# EAGLE design pcb_kamex_fuentes_5v_7amp_1.0 (EAGLE 7.6.0)
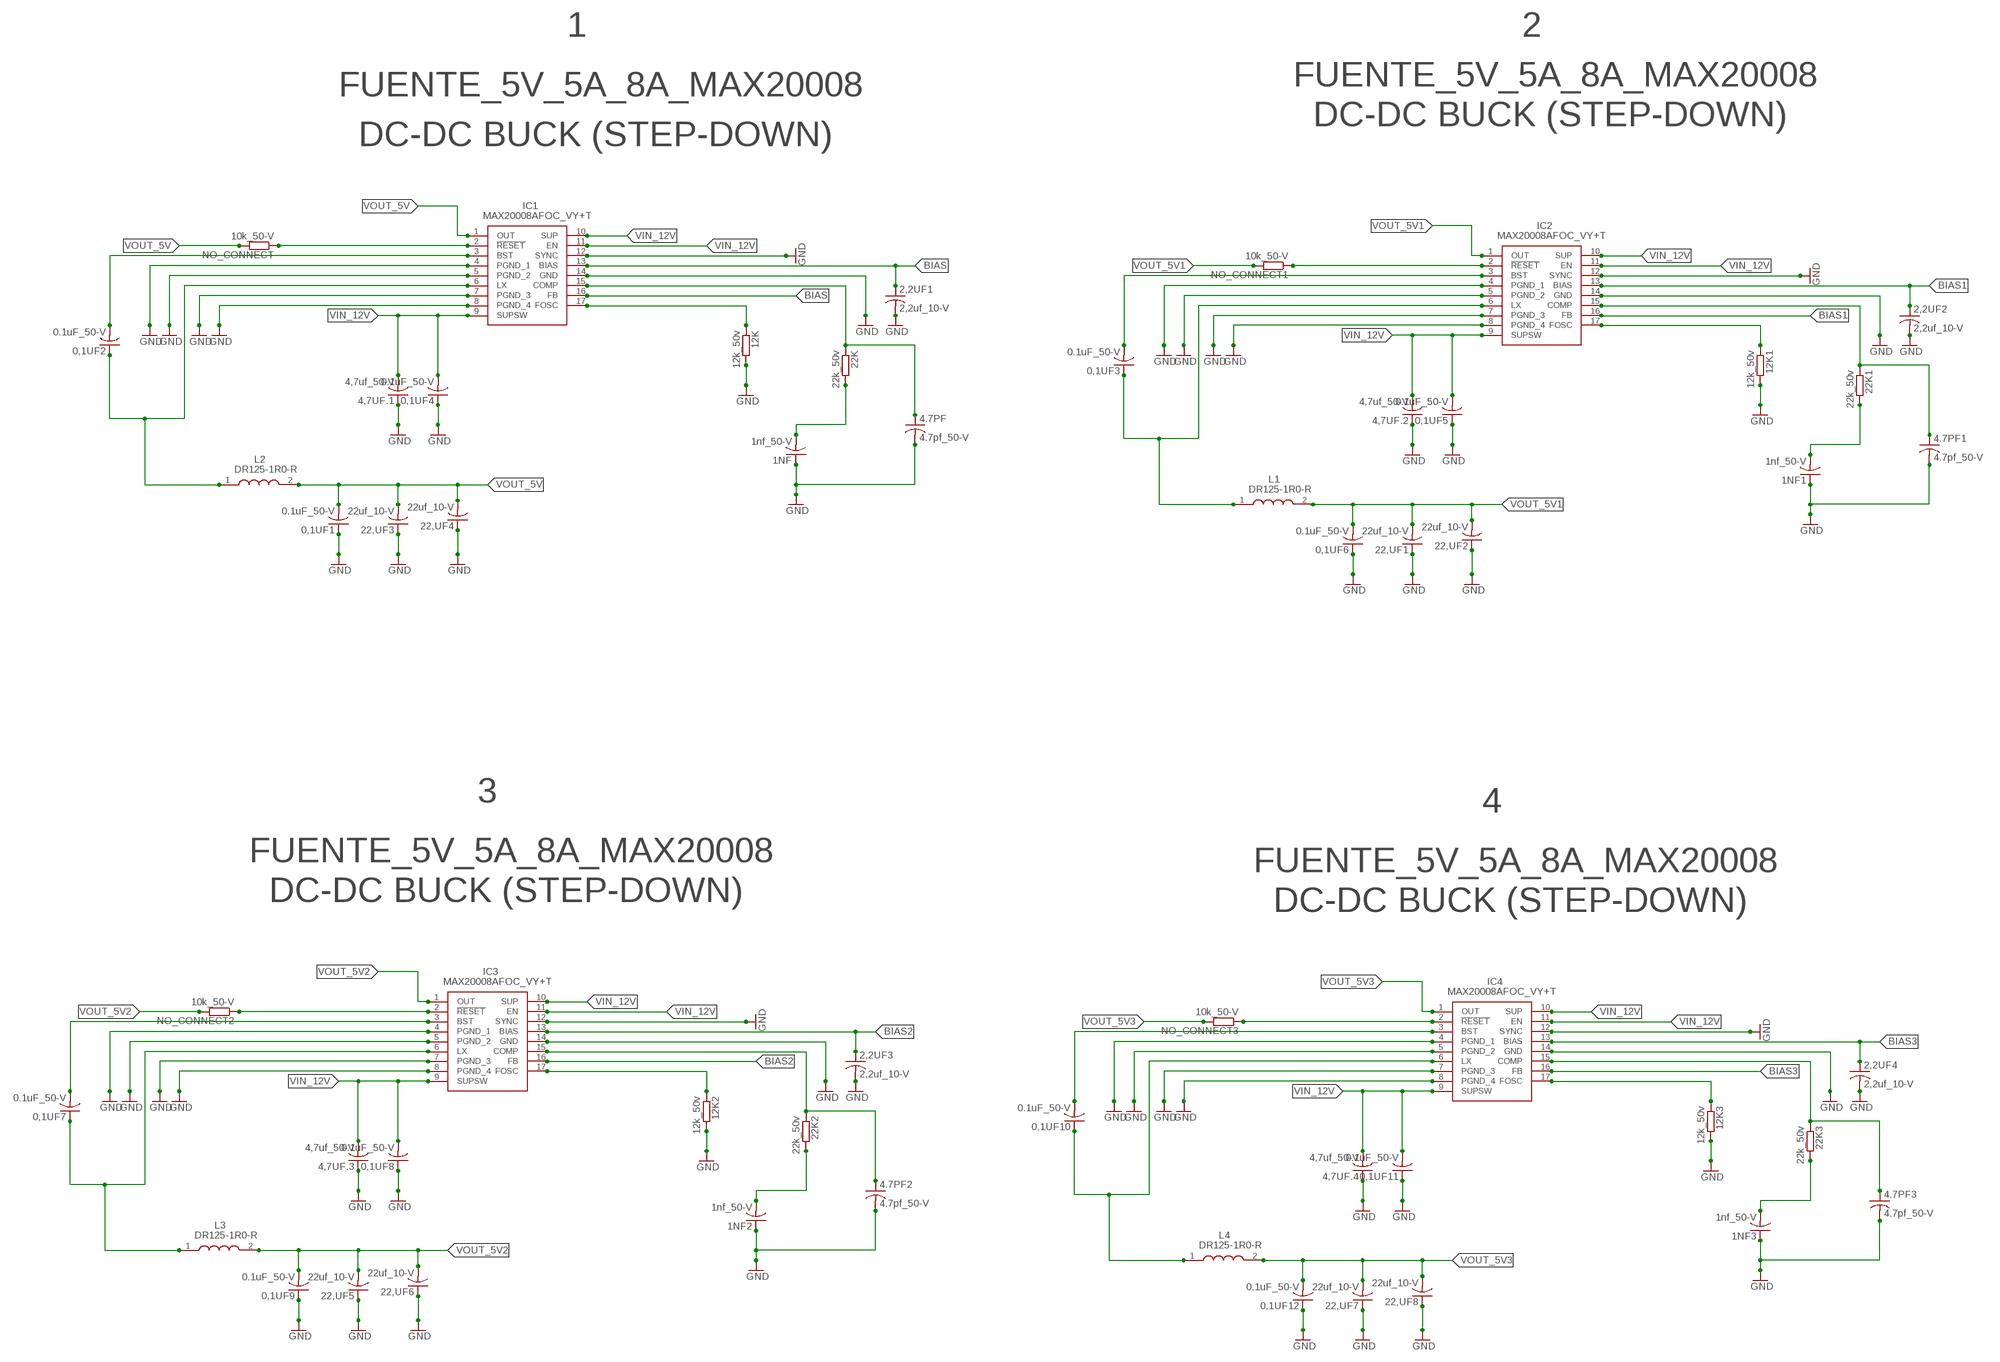
[diagram p0: schematic, sheet 1]

## Parts
0,1UF1  0.1uF_50-V  C-USC0805  [C0805]
0,1UF2  0.1uF_50-V  C-USC0805  [C0805]
0,1UF3  0.1uF_50-V  C-USC0805  [C0805]
0,1UF4  0.1uF_50-V  C-USC0805  [C0805]
0,1UF5  0.1uF_50-V  C-USC0805  [C0805]
0,1UF6  0.1uF_50-V  C-USC0805  [C0805]
0,1UF7  0.1uF_50-V  C-USC0805  [C0805]
0,1UF8  0.1uF_50-V  C-USC0805  [C0805]
0,1UF9  0.1uF_50-V  C-USC0805  [C0805]
0,1UF10  0.1uF_50-V  C-USC0805  [C0805]
0,1UF11  0.1uF_50-V  C-USC0805  [C0805]
0,1UF12  0.1uF_50-V  C-USC0805  [C0805]
1NF  1nf_50-V  C-USC0805  [C0805]
1NF1  1nf_50-V  C-USC0805  [C0805]
1NF2  1nf_50-V  C-USC0805  [C0805]
1NF3  1nf_50-V  C-USC0805  [C0805]
2,2UF1  2,2uf_10-V  C-USC0805  [C0805]
2,2UF2  2,2uf_10-V  C-USC0805  [C0805]
2,2UF3  2,2uf_10-V  C-USC0805  [C0805]
2,2UF4  2,2uf_10-V  C-USC0805  [C0805]
4,7UF.1  4,7uf_50-V  C-USC0805  [C0805]
4,7UF.2  4,7uf_50-V  C-USC0805  [C0805]
4,7UF.3  4,7uf_50-V  C-USC0805  [C0805]
4,7UF.4  4,7uf_50-V  C-USC0805  [C0805]
4.7PF  4.7pf_50-V  C-USC0805  [C0805]
4.7PF1  4.7pf_50-V  C-USC0805  [C0805]
4.7PF2  4.7pf_50-V  C-USC0805  [C0805]
4.7PF3  4.7pf_50-V  C-USC0805  [C0805]
12K  12k_50v  R-EU_M0805  [M0805]
12K1  12k_50v  R-EU_M0805  [M0805]
12K2  12k_50v  R-EU_M0805  [M0805]
12K3  12k_50v  R-EU_M0805  [M0805]
22,UF1  22uf_10-V  C-USC0805  [C0805]
22,UF2  22uf_10-V  C-USC0805  [C0805]
22,UF3  22uf_10-V  C-USC0805  [C0805]
22,UF4  22uf_10-V  C-USC0805  [C0805]
22,UF5  22uf_10-V  C-USC0805  [C0805]
22,UF6  22uf_10-V  C-USC0805  [C0805]
22,UF7  22uf_10-V  C-USC0805  [C0805]
22,UF8  22uf_10-V  C-USC0805  [C0805]
22K  22k_50v  R-EU_M0805  [M0805]
22K1  22k_50v  R-EU_M0805  [M0805]
22K2  22k_50v  R-EU_M0805  [M0805]
22K3  22k_50v  R-EU_M0805  [M0805]
IC1  MAX20008AFOC_VY+T  [MAX20008AFOCVYT]
IC2  MAX20008AFOC_VY+T  [MAX20008AFOCVYT]
IC3  MAX20008AFOC_VY+T  [MAX20008AFOCVYT]
IC4  MAX20008AFOC_VY+T  [MAX20008AFOCVYT]
L1  DR125-1R0-R  [INDPM125125X600N]
L2  DR125-1R0-R  [INDPM125125X600N]
L3  DR125-1R0-R  [INDPM125125X600N]
L4  DR125-1R0-R  [INDPM125125X600N]
NO_CONNECT  10k_50-V  R-EU_M0805  [M0805]
NO_CONNECT1  10k_50-V  R-EU_M0805  [M0805]
NO_CONNECT2  10k_50-V  R-EU_M0805  [M0805]
NO_CONNECT3  10k_50-V  R-EU_M0805  [M0805]

## Nets
BIAS: 2,2UF1.1 IC1.13(BIAS) IC1.16(FB)
BIAS1: 2,2UF2.1 IC2.13(BIAS) IC2.16(FB)
BIAS2: 2,2UF3.1 IC3.13(BIAS) IC3.16(FB)
BIAS3: 2,2UF4.1 IC4.13(BIAS) IC4.16(FB)
BST: 0,1UF2.2 IC1.3(BST)
BST1: 0,1UF3.2 IC2.3(BST)
BST2: 0,1UF7.2 IC3.3(BST)
BST3: 0,1UF10.2 IC4.3(BST)
COM: 4.7PF.1 22K.1 IC1.15(COMP)
COM1: 4.7PF1.1 22K1.1 IC2.15(COMP)
COM2: 4.7PF2.1 22K2.1 IC3.15(COMP)
COM3: 4.7PF3.1 22K3.1 IC4.15(COMP)
GND [power]: 0,1UF1.1 0,1UF4.1 0,1UF5.1 0,1UF6.1 0,1UF8.1 0,1UF9.1 0,1UF11.1 0,1UF12.1 1NF1.1 1NF2.1 1NF3.1 1NF.1 2,2UF1.2 2,2UF2.2 2,2UF3.2 2,2UF4.2 4,7UF.1.1 4,7UF.2.1 4,7UF.3.1 4,7UF.4.1 4.7PF1.2 4.7PF2.2 4.7PF3.2 4.7PF.2 12K1.2 12K2.2 12K3.2 12K.2 22,UF1.1 22,UF2.1 22,UF3.1 22,UF4.1 22,UF5.1 22,UF6.1 22,UF7.1 22,UF8.1 IC1.4(PGND_1) IC1.5(PGND_2) IC1.7(PGND_3) IC1.8(PGND_4) IC1.12(SYNC) IC1.14(GND) IC2.4(PGND_1) IC2.5(PGND_2) IC2.7(PGND_3) IC2.8(PGND_4) IC2.12(SYNC) IC2.14(GND) IC3.4(PGND_1) IC3.5(PGND_2) IC3.7(PGND_3) IC3.8(PGND_4) IC3.12(SYNC) IC3.14(GND) IC4.4(PGND_1) IC4.5(PGND_2) IC4.7(PGND_3) IC4.8(PGND_4) IC4.12(SYNC) IC4.14(GND)
N$1: 12K1.1 IC2.17(FOSC)
N$2: 1NF.2 22K.2
N$4: 0,1UF3.1 IC2.6(LX) L1.1
N$5: IC2.2(!RESET) NO_CONNECT1.1
N$6: 1NF1.2 22K1.2
N$7: 12K.1 IC1.17(FOSC)
N$9: 12K2.1 IC3.17(FOSC)
N$10: 0,1UF7.1 IC3.6(LX) L3.1
N$11: 0,1UF2.1 IC1.6(LX) L2.1
N$12: IC1.2(!RESET) NO_CONNECT.1
N$13: IC3.2(!RESET) NO_CONNECT2.1
N$14: 1NF2.2 22K2.2
N$16: 12K3.1 IC4.17(FOSC)
N$17: 0,1UF10.1 IC4.6(LX) L4.1
N$18: IC4.2(!RESET) NO_CONNECT3.1
N$19: 1NF3.2 22K3.2
VIN_12V [power]: 0,1UF4.2 0,1UF5.2 0,1UF8.2 0,1UF11.2 4,7UF.1.2 4,7UF.2.2 4,7UF.3.2 4,7UF.4.2 IC1.9(SUPSW) IC1.10(SUP) IC1.11(EN) IC2.9(SUPSW) IC2.10(SUP) IC2.11(EN) IC3.9(SUPSW) IC3.10(SUP) IC3.11(EN) IC4.9(SUPSW) IC4.10(SUP) IC4.11(EN)
VOUT_5V: 0,1UF1.2 22,UF3.2 22,UF4.2 IC1.1(OUT) L2.2 NO_CONNECT.2
VOUT_5V1: 0,1UF6.2 22,UF1.2 22,UF2.2 IC2.1(OUT) L1.2 NO_CONNECT1.2
VOUT_5V2: 0,1UF9.2 22,UF5.2 22,UF6.2 IC3.1(OUT) L3.2 NO_CONNECT2.2
VOUT_5V3: 0,1UF12.2 22,UF7.2 22,UF8.2 IC4.1(OUT) L4.2 NO_CONNECT3.2

## Notes on the sheet
- 1 | 2
- FUENTE_5V_5A_8A_MAX20008 | FUENTE_5V_5A_8A_MAX20008
- DC-DC BUCK (STEP-DOWN)
- DC-DC BUCK (STEP-DOWN)
- 3 | 4
- FUENTE_5V_5A_8A_MAX20008 | FUENTE_5V_5A_8A_MAX20008
- DC-DC BUCK (STEP-DOWN) | DC-DC BUCK (STEP-DOWN)

## Library data of the parts
0,1UF1-0,1UF12 1NF 1NF1-1NF3 2,2UF1-2,2UF4 4,7UF.1-4,7UF.4 4.7PF 4.7PF1-4.7PF3 22,UF1-22,UF8 = rcl:C-US: CAPACITOR, American symbol
12K 12K1-12K3 22K 22K1-22K3 NO_CONNECT NO_CONNECT1-NO_CONNECT3 = rcl_dani:R-EU_: RESISTOR, European symbol
IC1-IC4 = MAX20008AFOC_VY+T:MAX20008AFOC_VY+T: Switching Voltage Regulators 36V, 220kHz to 2.2MHz, 4A/6A/8A Fully integrated step down converter Source: Datasheet <https://componentsearchengine.com//MAX20008AFOC_VY T.pdf>; DESCRIPTION: Switching Voltage Regulators 36V, 220kHz to 2.2MHz, 4A/6A/8A Fully integrated step down converter; HEIGHT: 0.75mm; MANUFACTURER_NAME: Analog Devices; MANUFACTURER_PART_NUMBER: MAX20008AFOC/VY+T; MOUSER_PART_NUMBER: 700-MAX20008AFOC/VYT; MOUSER_PRICE-STOCK: https://www.mouser.co.uk/ProductDetail/Analog-Devices-Maxim-Integrated/MAX20008AFOC-VY%2bT?qs=vLWxofP3U2wvQQR8GkDmgw%3D%3D
L1-L4 = DR125-1R0-R:DR125-1R0-R: Inductor Power Shielded Drum Core 0.894uH/1uH 20% 100KHz Ferrite 15A 0.0024Ohm DCR T/R Source: Datasheet <https://www.eaton.com/content/dam/eaton/products/electronic-components/resources/data-sheet/eaton-dr-high-power-density-high-efficiency-shielded-drum-core-power-inductors-data-sheet.pdf>; DESCRIPTION: Inductor Power Shielded Drum Core 0.894uH/1uH 20% 100KHz Ferrite 15A 0.0024Ohm DCR T/R; HEIGHT: 6mm; MANUFACTURER_NAME: Eaton; MANUFACTURER_PART_NUMBER: DR125-1R0-R

## Net classes
0 default: width 0.381 mm, drill 0.01 mm, clearance 0.254 mm
1 power: width 1.27 mm, drill 0.762 mm, clearance 0.254 mm
2 thin: width 0.254 mm, drill 0.254 mm, clearance 0.254 mm

## Board
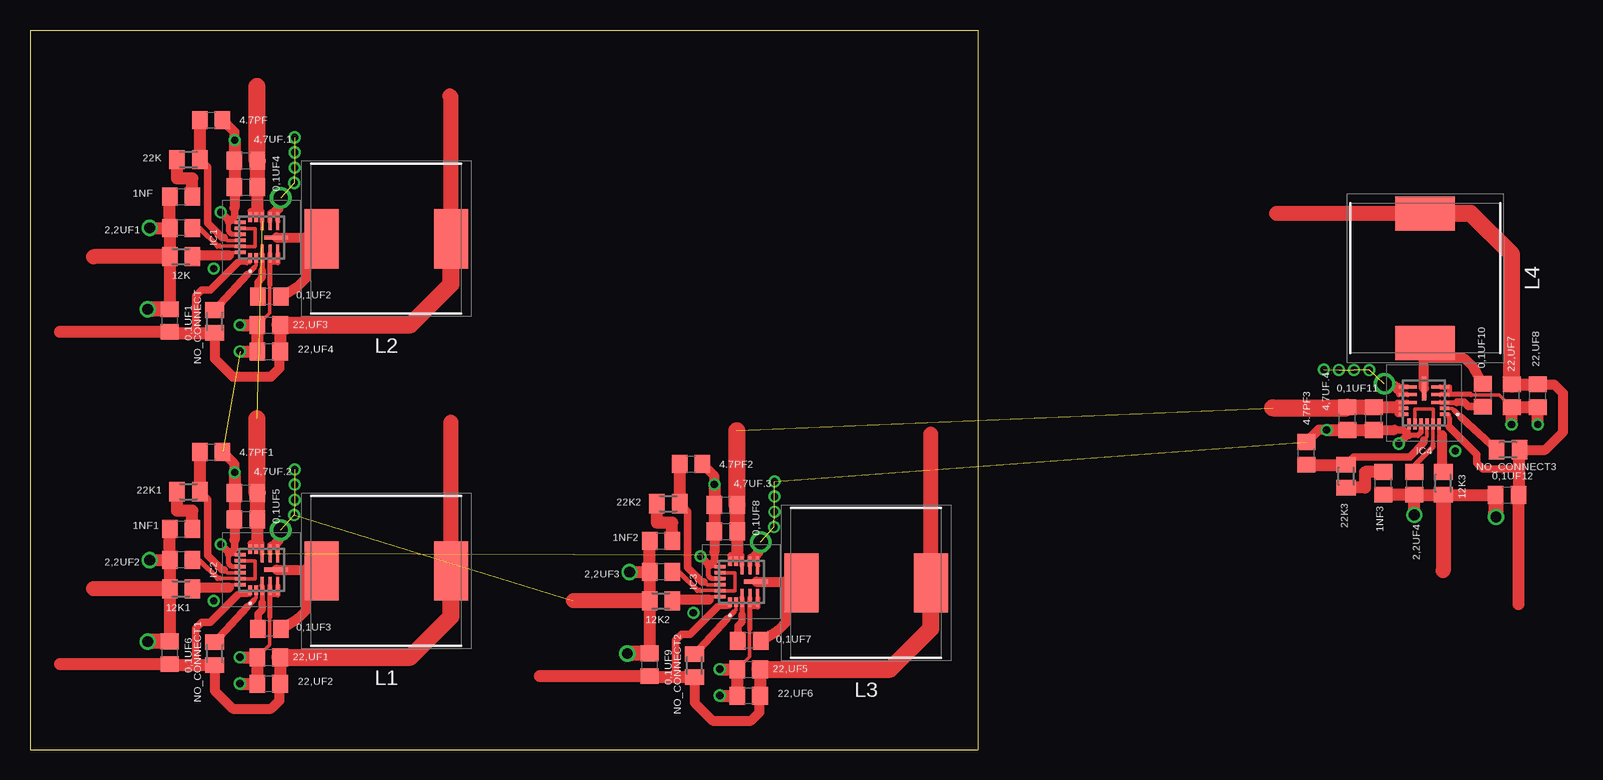
[diagram p1: board, top side]
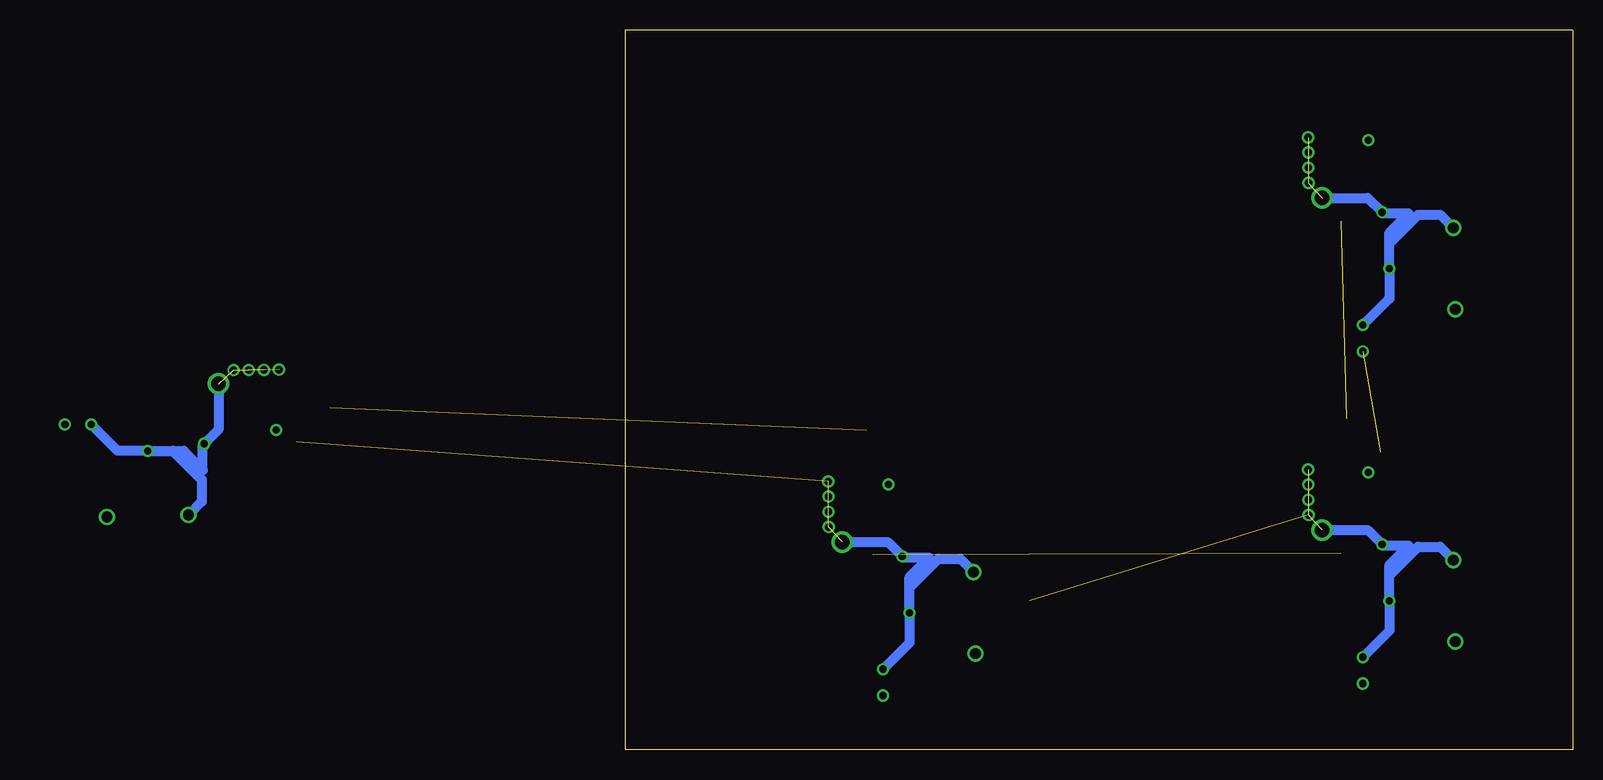
[diagram p2: board, bottom side, seen from below]

Size 79 x 60 mm. Coordinates in mm from the lower left corner, seen from the top.
Outline: 0,0 79,0 79,60 0,60 0,0
Copper layers (1*16): Top 0.035mm / dielectric 1.5mm / Bottom 0.035mm
Design rules "default *": minimum track width 10mil, minimum drill 24mil, track to track 8mil, track to pad 8mil, pad to pad 8mil, via to via 8mil, smd to smd 8mil, copper to edge 10mil, drill to drill 8mil, minimum pad ring 10mil, minimum via ring 8mil, stop-mask expansion 4mil, vias tented up to drill 0mil, thermal gap 10mil
Holes 3.2 mm at -98.9,24.6 -101,47.8

### Footprints (pad centres in the part's own frame; a part is rotated, then mirrored left to right if it is on the bottom)
C0805 = smd 1.3 x 1.5: 1 -0.95,0; 2 0.95,0
M0805 = smd 1.3 x 1.6: 1 -0.95,0; 2 0.95,0
MAX20008AFOCVYT = smd 0.8 x 0.3: 1 -1.7,0.948; 2 -1.7,0.45; 10 1.7,0.45; 11 1.7,0.948 | smd 1.5 x 0.25: 3 -1.35,-0.05; 4 -1.35,-0.7; 5 -1.35,-1.35; 7 1.35,-1.35; 8 1.35,-0.7; 9 1.35,-0.05 | smd 0.35 x 2: 6 0,-1.225 | smd 0.3 x 0.925: 12 1.25,1.763; 13 0.75,1.763; 14 0.25,1.763; 15 -0.25,1.763; 16 -0.75,1.763; 17 -1.25,1.763
INDPM125125X600N = smd 2.85 x 4.95: 1 -5.4,0; 2 5.4,0

### Placement (x,y rotation side)
0,1UF1  11.63,35.77 270 top
0,1UF2  19.95,37.78 180 top
0,1UF3  19.95,10.08 180 top
0,1UF4  18,46.9 0 top
0,1UF5  18,19.2 0 top
0,1UF6  11.63,8.07 270 top
0,1UF7  59.95,9.08 180 top
0,1UF8  58,18.2 0 top
0,1UF9  51.63,7.07 270 top
0,1UF10  121.12,29.55 270 top  (outside the outline)
0,1UF11  112,27.6 90 top  (outside the outline)
0,1UF12  123.13,21.23 0 top  (outside the outline)
1NF  12.6,46.1 0 top
1NF1  12.6,18.4 0 top
1NF2  52.6,17.4 0 top
1NF3  112.8,22.2 90 top  (outside the outline)
2,2UF1  12.6,43.5 180 top
2,2UF2  12.6,15.8 180 top
2,2UF3  52.6,14.8 180 top
2,2UF4  115.4,22.2 270 top  (outside the outline)
4,7UF.1  18,49.1 0 top
4,7UF.2  18,21.4 0 top
4,7UF.3  58,20.4 0 top
4,7UF.4  109.8,27.6 90 top  (outside the outline)
4.7PF  15.1,52.5 0 top
4.7PF1  15.1,24.8 0 top
4.7PF2  55.1,23.8 0 top
4.7PF3  106.4,24.7 90 top  (outside the outline)
12K  12.6,41.1 180 top
12K1  12.6,13.4 180 top
12K2  52.6,12.4 180 top
12K3  117.8,22.2 270 top  (outside the outline)
22,UF1  19.9,7.7 0 top
22,UF2  19.9,5.5 0 top
22,UF3  19.9,35.4 0 top
22,UF4  19.9,33.2 0 top
22,UF5  59.9,6.7 0 top
22,UF6  59.9,4.5 0 top
22,UF7  123.5,29.5 90 top  (outside the outline)
22,UF8  125.7,29.5 90 top  (outside the outline)
22K  13.2,49.2 180 top
22K1  13.2,21.5 180 top
22K2  53.2,20.5 180 top
22K3  109.7,22.8 270 top  (outside the outline)
IC1  19.3,42.7 90 top
IC2  19.3,15 90 top
IC3  59.3,14 90 top
IC4  116.2,28.9 180 top  (outside the outline)
L1  29.7,14.9 0 top
L2  29.7,42.6 0 top
L3  69.7,13.9 0 top
L4  116.3,39.3 90 top  (outside the outline)
NO_CONNECT  15.4,35.7 270 top
NO_CONNECT1  15.4,8 270 top
NO_CONNECT2  55.4,7 270 top
NO_CONNECT3  123.2,25 0 top  (outside the outline)

### Tracks (layer width: path | path; a pad name or v marks a point on that pad's centre or on a via)
BIAS
  Top 0.305: IC1.13 18.79,43.45 18.79,41.94 IC1.16 17.53,41.96 15.89,41.96 | 2,2UF1.1 13.6,43.5
  Top 0.406: 15.89,41.96 15.64,41.96 14.2,43.4 13.65,43.4 2,2UF1.1
BIAS1
  Top 0.305: IC2.13 18.79,15.75 18.79,14.24 IC2.16 17.53,14.26 15.89,14.26 | 2,2UF2.1 13.6,15.8
  Top 0.406: 15.89,14.26 15.64,14.26 14.2,15.7 13.65,15.7 2,2UF2.1
BIAS2
  Top 0.305: IC3.13 58.79,14.75 58.79,13.24 IC3.16 57.53,13.26 55.89,13.26 | 2,2UF3.1 53.6,14.8
  Top 0.406: 55.89,13.26 55.64,13.26 54.2,14.7 53.65,14.7 2,2UF3.1
BIAS3
  Top 0.305: IC4.13 115.45,28.39 116.96,28.39 IC4.16 116.94,27.13 116.94,25.49 | 2,2UF4.1 115.4,23.2
  Top 0.406: 116.94,25.49 116.94,25.24 115.5,23.8 115.5,23.25 2,2UF4.1
BST
  Top 0.406: IC1.3 19.35,39.95
  Top 0.61: 0,1UF2.2 19,39 19.3,39.3 19.3,39.32 19.36,39.38 19.36,39.94 19.35,39.95
BST1
  Top 0.406: IC2.3 19.35,12.25
  Top 0.61: 0,1UF3.2 19,11.3 19.3,11.6 19.3,11.62 19.36,11.68 19.36,12.24 19.35,12.25
BST2
  Top 0.406: IC3.3 59.35,11.25
  Top 0.61: 0,1UF7.2 59,10.3 59.3,10.6 59.3,10.62 59.36,10.68 59.36,11.24 59.35,11.25
BST3
  Top 0.406: IC4.3 118.95,28.95
  Top 0.61: 0,1UF10.2 119.9,28.6 119.6,28.9 119.58,28.9 119.52,28.96 118.96,28.96 118.95,28.95
COM
  Top 0.305: IC1.15 16.45,42.45 16.2,42.7
  Top 0.61: 16.2,42.7 16,42.7 14.8,43.9 14.8,48.55 22K.1
  Top 1.016: 4.7PF.1 22K.1
COM1
  Top 0.305: IC2.15 16.45,14.75 16.2,15
  Top 0.61: 16.2,15 16,15 14.8,16.2 14.8,20.85 22K1.1
  Top 1.016: 4.7PF1.1 22K1.1
COM2
  Top 0.305: IC3.15 56.45,13.75 56.2,14
  Top 0.61: 56.2,14 56,14 54.8,15.2 54.8,19.85 22K2.1
  Top 1.016: 4.7PF2.1 22K2.1
COM3
  Top 0.305: IC4.15 116.45,26.05 116.2,25.8
  Top 0.61: 116.2,25.8 116.2,25.6 115,24.4 110.35,24.4 22K3.1
  Top 1.016: 4.7PF3.1 22K3.1
GND  (via drill 0.6, 0.9, 1.2)  (19 unrouted)
  Top 0.305: 20,38.76 19.96,38.72 19.96,36.41 22,UF3.1 | IC1.12 17.53,43.96 16.58,43.96 16.57,43.97 | 20,11.06 19.96,11.02 19.96,8.71 22,UF1.1 | IC2.12 17.53,16.26 16.58,16.26 16.57,16.27 | 60,10.06 59.96,10.02 59.96,7.71 22,UF5.1 | IC3.12 57.53,15.26 56.58,15.26 56.57,15.27 | 120.14,29.6 120.18,29.56 122.49,29.56 22,UF7.1 | IC4.12 114.94,27.13 114.94,26.18 114.93,26.17
  Top 0.406: IC1.7 20.65,44.8 | 20.65,44.8 20.4,44.8 20,44.8 IC1.8 | IC1.5 20.65,40.58 20.66,40.58 20.66,40.59 20,40.59 | 20,40.59 IC1.4 | 20.65,44.8 20.7,44.8 | IC1.14 16.83,42.95 16.58,43.2 16.58,43.96 | 20,38.76 20,40.59 | IC2.7 20.65,17.1 | 20.65,17.1 20.4,17.1 20,17.1 IC2.8 | IC2.5 20.65,12.88 20.66,12.88 20.66,12.89 20,12.89 | 20,12.89 IC2.4 | 20.65,17.1 20.7,17.1 | IC2.14 16.83,15.25 16.58,15.5 16.58,16.26 | 20,11.06 20,12.89 | IC3.7 60.65,16.1 | 60.65,16.1 60.4,16.1 60,16.1 IC3.8 | IC3.5 60.65,11.88 60.66,11.88 60.66,11.89 60,11.89 | 60,11.89 IC3.4 | 60.65,16.1 60.7,16.1 | IC3.14 56.83,14.25 56.58,14.5 56.58,15.26 | 60,10.06 60,11.89 | IC4.7 114.1,30.25 | 114.1,30.25 114.1,30 114.1,29.6 IC4.8 | IC4.5 118.32,30.25 118.32,30.26 118.31,30.26 118.31,29.6 | 118.31,29.6 IC4.4 | 114.1,30.25 114.1,30.3 | IC4.14 115.95,26.43 115.7,26.18 114.94,26.18 | 120.14,29.6 118.31,29.6
  Top 0.61: 17.05,45.17 17.05,44.43 16.58,43.96 | 16.57,43.97 16.57,44.13 v15.9,44.8 | 17.05,17.47 17.05,16.73 16.58,16.26 | 16.57,16.27 16.57,16.43 v15.9,17.1 | 57.05,16.47 57.05,15.73 56.58,15.26 | 56.57,15.27 56.57,15.43 v55.9,16.1 | 113.73,26.65 114.47,26.65 114.94,26.18 | 114.93,26.17 114.77,26.17 v114.1,25.5
  Top 0.813: 0,1UF4.1 17.05,45.17 | 20.4,44.8 20.7,45.1 20.7,45.8 v20.9,46 | v17.05,50.81 17.05,51.5 4.7PF.2 | 0,1UF5.1 17.05,17.47 | 20.4,17.1 20.7,17.4 20.7,18.1 v20.9,18.3 | v17.05,23.11 17.05,23.8 4.7PF1.2 | 0,1UF8.1 57.05,16.47 | 60.4,16.1 60.7,16.4 60.7,17.1 v60.9,17.3 | v57.05,22.11 57.05,22.8 4.7PF2.2 | 0,1UF11.1 113.73,26.65 | 114.1,30 113.8,30.3 113.1,30.3 v112.9,30.5 | v108.09,26.65 107.4,26.65 4.7PF3.2
  Top 1.016: 0,1UF4.1 4,7UF.1.1 v17.05,50.81 | 2,2UF1.2 1NF.1 | v17.5,35.4 22,UF3.1 22,UF4.1 v17.5,33.2 | 2,2UF1.2 12K.2 11.65,36.74 0,1UF1.1 | v9.97,43.5 2,2UF1.2 | 0,1UF5.1 4,7UF.2.1 v17.05,23.11 | 2,2UF2.2 1NF1.1 | v17.5,7.7 22,UF1.1 22,UF2.1 v17.5,5.5 | 2,2UF2.2 12K1.2 11.65,9.04 0,1UF6.1 | v9.97,15.8 2,2UF2.2 | 0,1UF8.1 4,7UF.3.1 v57.05,22.11 | 2,2UF3.2 1NF2.1 | v57.5,6.7 22,UF5.1 22,UF6.1 v57.5,4.5 | 2,2UF3.2 12K2.2 51.65,8.04 0,1UF9.1 | v49.97,14.8 2,2UF3.2 | 0,1UF11.1 4,7UF.4.1 v108.09,26.65 | 2,2UF4.2 1NF3.1 | v123.5,27.1 22,UF7.1 22,UF8.1 v125.7,27.1 | 2,2UF4.2 12K3.2 122.16,21.25 0,1UF12.1 | v115.4,19.57 2,2UF4.2
  Top 1.27: 12K.2 5.3,41.1 | 0,1UF1.1 10.12,36.72 v9.8,36.7 | 12K1.2 5.3,13.4 | 0,1UF6.1 10.12,9.02 v9.8,9 | 12K2.2 45.3,12.4 | 0,1UF9.1 50.12,8.02 v49.8,8 | 12K3.2 117.8,14.9 | 0,1UF12.1 122.18,19.72 v122.2,19.4
  Bottom 0.813: v20.9,46 17.1,46 v15.9,44.8 15.8,44.7 13.7,44.7 15.3,43.1 15.3,42.2 | 15.3,42.2 v15.3,40.1 15.3,37.6 v17.5,35.4 | 15.3,42.2 12.9,44.6 11.07,44.6 v9.97,43.5 | v20.9,18.3 17.1,18.3 v15.9,17.1 15.8,17 13.7,17 15.3,15.4 15.3,14.5 | 15.3,14.5 v15.3,12.4 15.3,9.9 v17.5,7.7 | 15.3,14.5 12.9,16.9 11.07,16.9 v9.97,15.8 | v60.9,17.3 57.1,17.3 v55.9,16.1 55.8,16 53.7,16 55.3,14.4 55.3,13.5 | 55.3,13.5 v55.3,11.4 55.3,8.9 v57.5,6.7 | 55.3,13.5 52.9,15.9 51.07,15.9 v49.97,14.8 | v112.9,30.5 112.9,26.7 v114.1,25.5 114.2,25.4 114.2,23.3 115.8,24.9 116.7,24.9 | 116.7,24.9 v118.8,24.9 121.3,24.9 v123.5,27.1 | 116.7,24.9 114.3,22.5 114.3,20.67 v115.4,19.57
  other vias: 22.06,49.79 22.05,48.53 22.03,47.25 22.07,51.04 22.06,22.09 22.05,20.83 22.03,19.55 22.07,23.34 62.06,21.09 62.05,19.83 62.03,18.55 62.07,22.34 109.11,31.66 110.37,31.65 111.65,31.63 107.86,31.67
  cutout Bottom: 23.4,43.4 20.99,43.4 20.99,43.14 19.39,43.14 19.39,42.28 21,42.28 21,40 20.4,40 20.4,38.8 21.6,38.8 21.9,39 21.99,39.05 22.06,39.09 22.4,39.3 22.4,42 23.4,42
  cutout Bottom: 23.4,15.7 20.99,15.7 20.99,15.44 19.39,15.44 19.39,14.58 21,14.58 21,12.3 20.4,12.3 20.4,11.1 21.6,11.1 21.9,11.3 21.99,11.35 22.06,11.39 22.4,11.6 22.4,14.3 23.4,14.3
  cutout Bottom: 63.4,14.7 60.99,14.7 60.99,14.44 59.39,14.44 59.39,13.58 61,13.58 61,11.3 60.4,11.3 60.4,10.1 61.6,10.1 61.9,10.3 61.99,10.35 62.06,10.39 62.4,10.6 62.4,13.3 63.4,13.3
  cutout Bottom: 115.5,33 115.5,30.59 115.76,30.59 115.76,28.99 116.62,28.99 116.62,30.6 118.9,30.6 118.9,30 120.1,30 120.1,31.2 119.9,31.5 119.85,31.59 119.81,31.66 119.6,32 116.9,32 116.9,33
N$1
  Top 0.305: 13.9,13.75 12K1.1 | IC2.17 16.85,13.75 16.6,13.5
  Top 0.813: 16.6,13.5 13.65,13.5 12K1.1
N$2
  Top 1.016: 1NF.2 13.53,46.1 13.53,47.61 12.25,47.61 22K.2
N$3
  cutout Top (isolate 0.2, rank 2): 19.39,43.14 19.39,42.28 21,42.28 21,40 20.4,40 20.4,38.8 21.6,38.8 22.4,39.3 22.4,42 22.7,42 22.7,39.9 26,39.9 26,45.3 22.7,45.3 22.7,43.4 20.98,43.4 20.98,43.14
N$4
  Top 0.813: IC2.6 23.1,15 23,11.6 22.3,10.9 0,1UF3.1
  Top 1.016: 23.1,15 24.2,15 L1.1
N$5
  Top 0.305: 15.82,9.37 NO_CONNECT1.1 | IC2.2 18.85,12.65 18.7,12.5
  Top 0.406: 18.7,12.5 18.1,11.9
  Top 0.61: 18.1,11.9 NO_CONNECT1.1
N$6
  Top 1.016: 1NF1.2 13.53,18.4 13.53,19.91 12.25,19.91 22K1.2
N$7
  Top 0.305: 13.9,41.45 12K.1 | IC1.17 16.85,41.45 16.6,41.2
  Top 0.813: 16.6,41.2 13.65,41.2 12K.1
N$8
  cutout Top (isolate 0.2, rank 2): 19.39,15.44 19.39,14.58 21,14.58 21,12.3 20.4,12.3 20.4,11.1 21.6,11.1 22.4,11.6 22.4,14.3 22.7,14.3 22.7,12.2 26,12.2 26,17.6 22.7,17.6 22.7,15.7 20.98,15.7 20.98,15.44
N$9
  Top 0.305: 53.9,12.75 12K2.1 | IC3.17 56.85,12.75 56.6,12.5
  Top 0.813: 56.6,12.5 53.65,12.5 12K2.1
N$10
  Top 0.813: IC3.6 63.1,14 63,10.6 62.3,9.9 0,1UF7.1
  Top 1.016: 63.1,14 64.2,14 L3.1
N$11
  Top 0.813: IC1.6 23.1,42.7 23,39.3 22.3,38.6 0,1UF2.1
  Top 1.016: 23.1,42.7 24.2,42.7 L2.1
N$12
  Top 0.305: 15.82,37.07 NO_CONNECT.1 | IC1.2 18.85,40.35 18.7,40.2
  Top 0.406: 18.7,40.2 18.1,39.6
  Top 0.61: 18.1,39.6 NO_CONNECT.1
N$13
  Top 0.305: 55.82,8.37 NO_CONNECT2.1 | IC3.2 58.85,11.65 58.7,11.5
  Top 0.406: 58.7,11.5 58.1,10.9
  Top 0.61: 58.1,10.9 NO_CONNECT2.1
N$14
  Top 1.016: 1NF2.2 53.53,17.4 53.53,18.91 52.25,18.91 22K2.2
N$15
  cutout Top (isolate 0.2, rank 2): 59.39,14.44 59.39,13.58 61,13.58 61,11.3 60.4,11.3 60.4,10.1 61.6,10.1 62.4,10.6 62.4,13.3 62.7,13.3 62.7,11.2 66,11.2 66,16.6 62.7,16.6 62.7,14.7 60.98,14.7 60.98,14.44
N$16
  Top 0.305: 117.45,23.5 12K3.1 | IC4.17 117.45,26.45 117.7,26.2
  Top 0.813: 117.7,26.2 117.7,23.25 12K3.1
N$17
  Top 0.813: IC4.6 116.2,32.7 119.6,32.6 120.3,31.9 0,1UF10.1
  Top 1.016: 116.2,32.7 116.2,33.8 L4.1
N$18
  Top 0.305: 121.83,25.42 NO_CONNECT3.1 | IC4.2 118.55,28.45 118.7,28.3
  Top 0.406: 118.7,28.3 119.3,27.7
  Top 0.61: 119.3,27.7 NO_CONNECT3.1
N$19
  Top 1.016: 1NF3.2 112.8,23.13 111.29,23.13 111.29,21.85 22K3.2
N$20
  cutout Top (isolate 0.2, rank 2): 115.76,28.99 116.62,28.99 116.62,30.6 118.9,30.6 118.9,30 120.1,30 120.1,31.2 119.6,32 116.9,32 116.9,32.3 119,32.3 119,35.6 113.6,35.6 113.6,32.3 115.5,32.3 115.5,30.58 115.76,30.58
VIN_12V  (3 unrouted)
  Top 0.406: IC1.9 19.35,44.93 18.9,44.93 18.8,44.93 | 18.8,44.93 18.37,44.93 18.35,44.91 IC1.11 | IC1.10 18.85,44.88 18.8,44.93 | IC2.9 19.35,17.23 18.9,17.23 18.8,17.23 | 18.8,17.23 18.37,17.23 18.35,17.21 IC2.11 | IC2.10 18.85,17.18 18.8,17.23 | IC3.9 59.35,16.23 58.9,16.23 58.8,16.23 | 58.8,16.23 58.37,16.23 58.35,16.21 IC3.11 | IC3.10 58.85,16.18 58.8,16.23 | IC4.9 113.97,28.95 113.97,28.5 113.97,28.4 | 113.97,28.4 113.97,27.97 113.99,27.95 IC4.11 | IC4.10 114.02,28.45 113.97,28.4
  Top 1.016: 0,1UF4.2 18.95,44.98 18.9,44.93 | 0,1UF5.2 18.95,17.28 18.9,17.23 | 0,1UF8.2 58.95,16.28 58.9,16.23 | 0,1UF11.2 113.92,28.55 113.97,28.5
  Top 1.27: 4,7UF.1.2 0,1UF4.2 | 4,7UF.2.2 0,1UF5.2 | 4,7UF.3.2 0,1UF8.2 | 4,7UF.4.2 0,1UF11.2
  Top 1.422: 18.9,55.3 18.9,49.15 4,7UF.1.2 | 18.9,27.6 18.9,21.45 4,7UF.2.2 | 58.9,26.6 58.9,20.45 4,7UF.3.2 | 103.6,28.5 109.75,28.5 4,7UF.4.2
VOUT_5V
  Top 0.305: 22,UF4.2 | 0,1UF1.2 11.6,34.75 | IC1.1 18.35,40.6 18.1,40.6
  Top 0.406: 18.1,40.6 17.3,40.6
  Top 0.61: 17.3,40.6 15,38.3 14.3,38.3 13.8,37.8 13.8,34.75
  Top 0.813: NO_CONNECT.2 15.4,32.6 16.9,31.1 20.1,31.1 20.8,31.8 20.8,33.15 22,UF4.2
  Top 1.016: 22,UF3.2 22,UF4.2 | 0,1UF1.2 2.52,34.82 | 11.6,34.75 13.8,34.75 NO_CONNECT.2
  Top 1.27: L2.2 35.1,54.4 35,54.5
  Top 1.422: 22,UF3.2 31.7,35.4 35.1,38.8 L2.2
VOUT_5V1
  Top 0.305: 22,UF2.2 | 0,1UF6.2 11.6,7.05 | IC2.1 18.35,12.9 18.1,12.9
  Top 0.406: 18.1,12.9 17.3,12.9
  Top 0.61: 17.3,12.9 15,10.6 14.3,10.6 13.8,10.1 13.8,7.05
  Top 0.813: NO_CONNECT1.2 15.4,4.9 16.9,3.4 20.1,3.4 20.8,4.1 20.8,5.45 22,UF2.2
  Top 1.016: 22,UF1.2 22,UF2.2 | 0,1UF6.2 2.52,7.12 | 11.6,7.05 13.8,7.05 NO_CONNECT1.2
  Top 1.27: L1.2 35.1,27.3
  Top 1.422: 22,UF1.2 31.7,7.7 35.1,11.1 L1.2
VOUT_5V2
  Top 0.305: 22,UF6.2 | 0,1UF9.2 51.6,6.05 | IC3.1 58.35,11.9 58.1,11.9
  Top 0.406: 58.1,11.9 57.3,11.9
  Top 0.61: 57.3,11.9 55,9.6 54.3,9.6 53.8,9.1 53.8,6.05
  Top 0.813: NO_CONNECT2.2 55.4,3.9 56.9,2.4 60.1,2.4 60.8,3.1 60.8,4.45 22,UF6.2
  Top 1.016: 22,UF5.2 22,UF6.2 | 0,1UF9.2 42.52,6.12 | 51.6,6.05 53.8,6.05 NO_CONNECT2.2
  Top 1.27: L3.2 75.1,26.3
  Top 1.422: 22,UF5.2 71.7,6.7 75.1,10.1 L3.2
VOUT_5V3
  Top 0.305: 22,UF8.2 | 0,1UF12.2 124.15,21.2 | IC4.1 118.3,27.95 118.3,27.7
  Top 0.406: 118.3,27.7 118.3,26.9
  Top 0.61: 118.3,26.9 120.6,24.6 120.6,23.9 121.1,23.4 124.15,23.4
  Top 0.813: NO_CONNECT3.2 126.3,25 127.8,26.5 127.8,29.7 127.1,30.4 125.75,30.4 22,UF8.2
  Top 1.016: 22,UF7.2 22,UF8.2 | 0,1UF12.2 124.08,12.12 | 124.15,21.2 124.15,23.4 NO_CONNECT3.2
  Top 1.27: L4.2 103.9,44.7
  Top 1.422: 22,UF7.2 123.5,41.3 120.1,44.7 L4.2